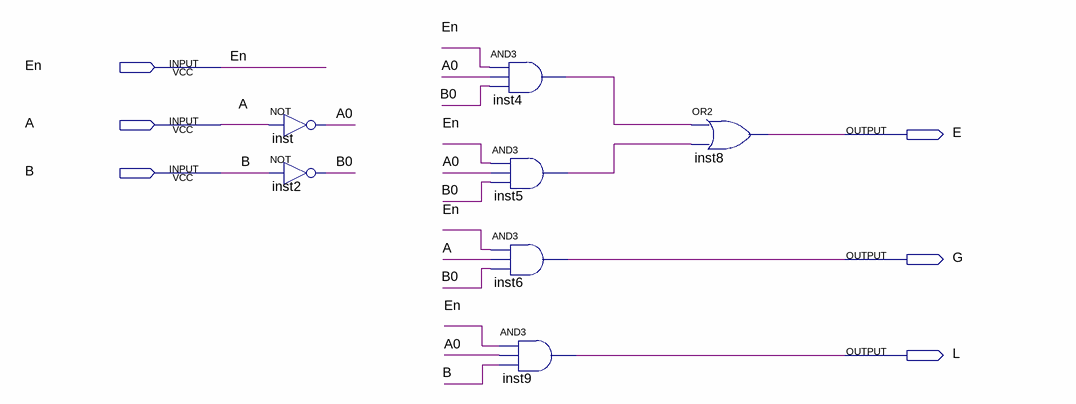
[diagram p0: schematic sheet]
// Quartus schematic CPLD_CMP.bdf as structural Verilog: 7 symbols, 6 pins
module CPLD_CMP (
  input  En,
  input  A,
  input  B,
  output E,
  output G,
  output L
);

  wire A0, B0, inst4_out, inst5_out;

  not inst (A0, A);
  not inst2 (B0, B);
  and inst4 (inst4_out, En, A0, B0);
  and inst5 (inst5_out, En, A0, B0);
  and inst6 (G, En, A, B0);
  and inst9 (L, En, A0, B);
  or inst8 (E, inst4_out, inst5_out);
endmodule
